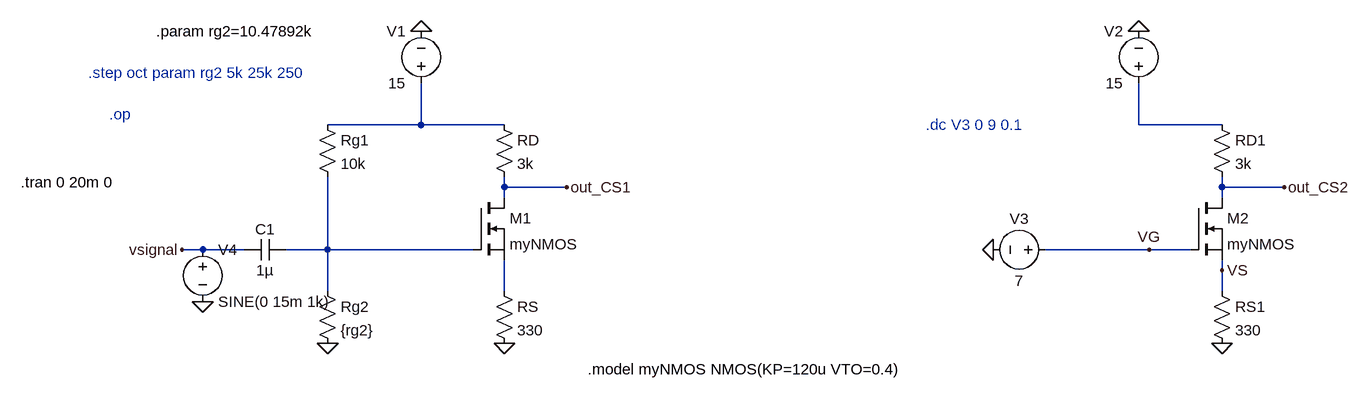
[diagram p0: schematic E3.asc]
E3.asc, the LTspice schematic file:
Version 4.1
SHEET 1 1444 680
WIRE 0 80 0 16
WIRE 0 80 -144 80
WIRE 128 80 0 80
WIRE 1104 80 1104 16
WIRE 1232 80 1104 80
WIRE 128 176 128 160
WIRE 224 176 128 176
WIRE 1232 176 1232 160
WIRE 1328 176 1232 176
WIRE 128 192 128 176
WIRE 1232 192 1232 176
WIRE -336 272 -368 272
WIRE -272 272 -336 272
WIRE -144 272 -144 160
WIRE -144 272 -208 272
WIRE 80 272 -144 272
WIRE 1120 272 960 272
WIRE 1184 272 1120 272
WIRE 1232 304 1232 288
WIRE -144 336 -144 272
WIRE 128 336 128 288
WIRE 1232 336 1232 304
FLAG 0 -64 0
FLAG 128 416 0
FLAG -144 416 0
FLAG 224 176 out_CS1
FLAG 1104 -64 0
FLAG 1232 416 0
FLAG 1328 176 out_CS2
FLAG -368 272 vsignal
FLAG 880 272 0
FLAG 1120 272 VG
FLAG 1232 304 VS
FLAG -336 352 0
SYMBOL nmos 80 192 R0
SYMATTR InstName M1
SYMATTR Value myNMOS
SYMBOL res 112 64 R0
SYMATTR InstName RD
SYMATTR Value 3k
SYMBOL res 112 320 R0
SYMATTR InstName RS
SYMATTR Value 330
SYMBOL voltage 0 32 R180
WINDOW 0 24 96 Left 2
WINDOW 3 24 16 Left 2
WINDOW 123 0 0 Left 0
WINDOW 39 0 0 Left 0
SYMATTR InstName V1
SYMATTR Value 15
SYMBOL res -160 64 R0
SYMATTR InstName Rg1
SYMATTR Value 10k
SYMBOL res -160 320 R0
SYMATTR InstName Rg2
SYMATTR Value {rg2}
SYMBOL cap -208 256 R90
WINDOW 0 0 32 VBottom 2
WINDOW 3 32 32 VTop 2
SYMATTR InstName C1
SYMATTR Value 1µ
SYMBOL nmos 1184 192 R0
SYMATTR InstName M2
SYMATTR Value myNMOS
SYMBOL res 1216 64 R0
SYMATTR InstName RD1
SYMATTR Value 3k
SYMBOL res 1216 320 R0
SYMATTR InstName RS1
SYMATTR Value 330
SYMBOL voltage 1104 32 R180
WINDOW 0 24 96 Left 2
WINDOW 3 24 16 Left 2
WINDOW 123 0 0 Left 0
WINDOW 39 0 0 Left 0
SYMATTR InstName V2
SYMATTR Value 15
SYMBOL voltage 976 272 R90
WINDOW 0 -32 56 VBottom 2
WINDOW 3 32 56 VTop 2
WINDOW 123 0 0 Left 0
WINDOW 39 0 0 Left 0
SYMATTR InstName V3
SYMATTR Value 7
SYMBOL voltage -336 256 R0
WINDOW 123 0 0 Left 0
WINDOW 39 0 0 Left 0
SYMATTR InstName V4
SYMATTR Value SINE(0 15m 1k)
TEXT -408 -64 Left 2 !.param rg2=10.47892k
TEXT -512 0 Left 2 ;.step oct param rg2 5k 25k 250
TEXT -480 64 Left 2 ;.op
TEXT 776 80 Left 2 ;.dc V3 0 9 0.1
TEXT 256 456 Left 2 !.model myNMOS NMOS(KP=120u VTO=0.4)
TEXT -616 168 Left 2 !.tran 0 20m 0

The netlist it stands for:
* E3.asc
M1 out_CS1 N003 N004 N004 myNMOS
RD N001 out_CS1 3k
RS N004 0 330
V1 N001 0 15
Rg1 N001 N003 10k
Rg2 N003 0 {rg2}
C1 N003 vsignal 1µ
M2 out_CS2 VG VS VS myNMOS
RD1 N002 out_CS2 3k
RS1 VS 0 330
V2 N002 0 15
V3 VG 0 7
V4 vsignal 0 SINE(0 15m 1k)
.model NMOS NMOS
.model PMOS PMOS
.lib standard.mos
.param rg2=10.47892k
* .step oct param rg2 5k 25k 250
* .op
* .dc V3 0 9 0.1
.model myNMOS NMOS(KP=120u VTO=0.4)
.tran 0 20m 0
.backanno
.end